# Altium schematic sheet 01_10_POWER_INPUT.SchDoc
size 289 x 396 mm
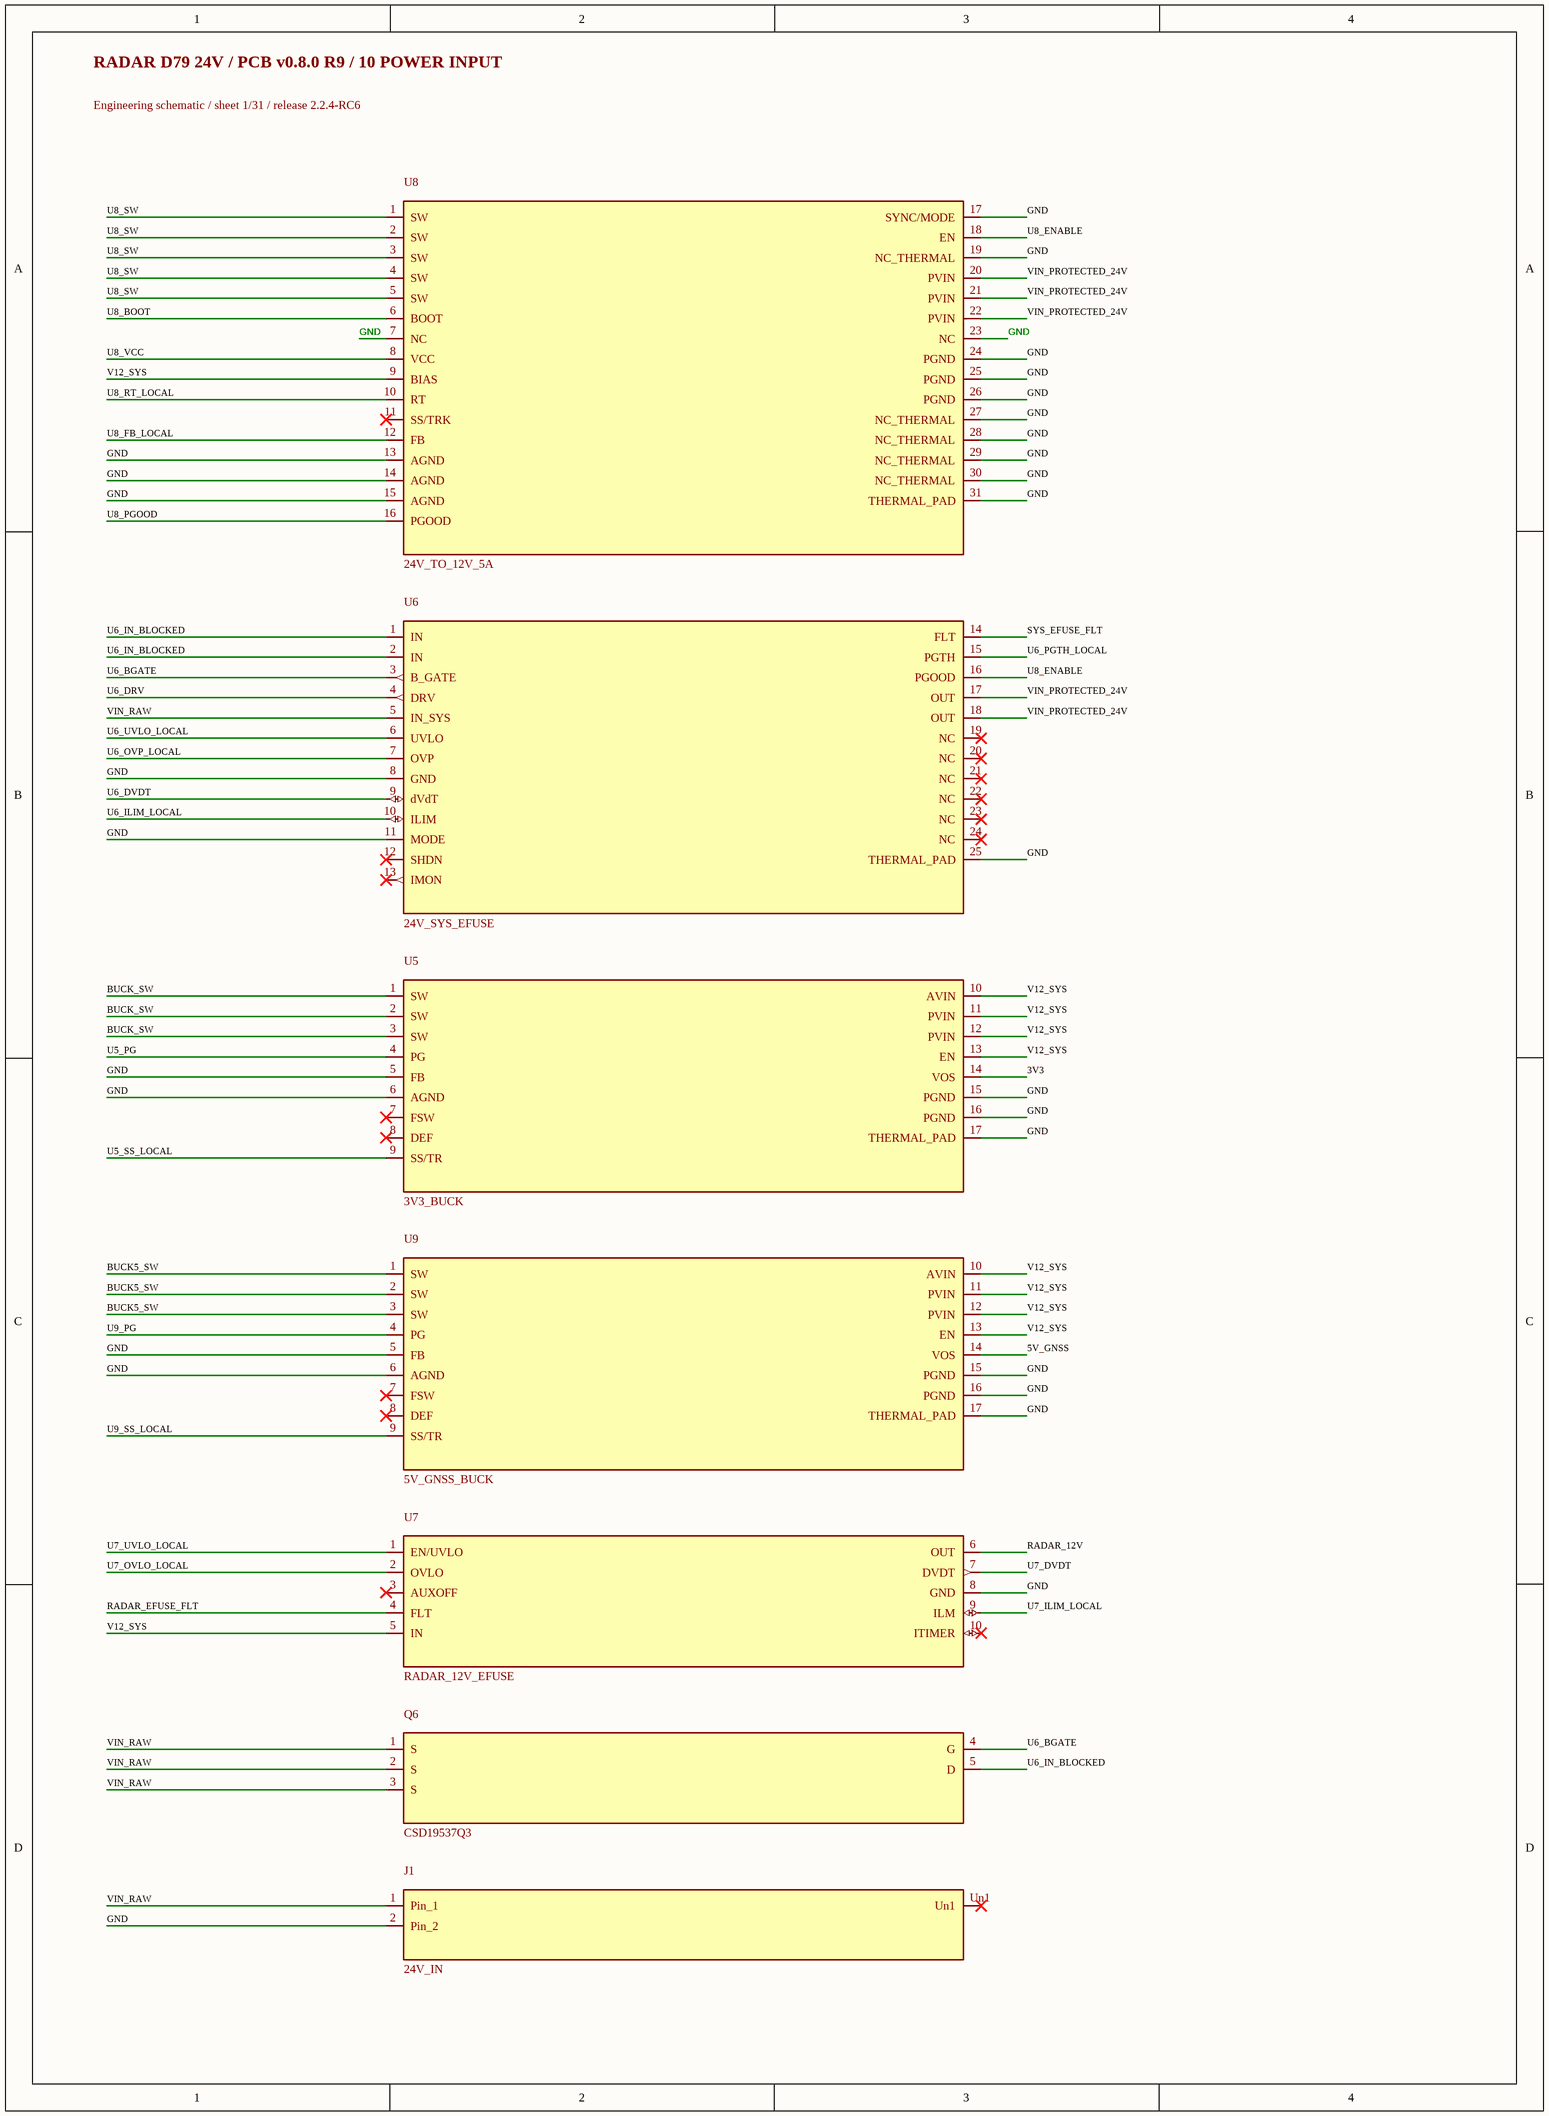
[diagram p0: 01_10_POWER_INPUT.SchDoc]

## Parts
J1  24V_IN  [Molex_43650-0200_RA_THT_2P]
Q6  CSD19537Q3  [VSON-8_3.3x3.3mm_P0.65mm_NexFET]
U5  3V3_BUCK  [VQFN-16-1EP_3x3mm_P0.5mm_EP1.68x1.68mm]
U6  24V_SYS_EFUSE  [Texas_RGE0024C_VQFN-24-1EP_4x4mm_P0.5mm_EP2.1x2.1mm]
U7  RADAR_12V_EFUSE  [TPS259470A_RPW0010A_VQFN-HR-10_2x2mm_P0.475mm]
U8  24V_TO_12V_5A  [Texas_RNP0030B_WQFN-30-1EP_4x6mm_P0.5mm_EP1.8x4.5mm_ThermalVias]
U9  5V_GNSS_BUCK  [VQFN-16-1EP_3x3mm_P0.5mm_EP1.68x1.68mm]

## Nets
3V3: U5.14(VOS)
5V_GNSS: U9.14(VOS)
BUCK5_SW: U9.1(SW) U9.2(SW) U9.3(SW)
BUCK_SW: U5.1(SW) U5.2(SW) U5.3(SW)
GND: J1.2(Pin_2) U5.5(FB) U5.6(AGND) U5.15(PGND) U5.16(PGND) U5.17(THERMAL_PAD) U6.8(GND) U6.11(MODE) U6.25(THERMAL_PAD) U7.8(GND) U8.7(NC) U8.13(AGND) U8.14(AGND) U8.15(AGND) U8.17(SYNC/MODE) U8.19(NC_THERMAL) U8.23(NC) U8.24(PGND) U8.25(PGND) U8.26(PGND) U8.27(NC_THERMAL) U8.28(NC_THERMAL) U8.29(NC_THERMAL) U8.30(NC_THERMAL) U8.31(THERMAL_PAD) U9.5(FB) U9.6(AGND) U9.15(PGND) U9.16(PGND) U9.17(THERMAL_PAD)
RADAR_12V: U7.6(OUT)
RADAR_EFUSE_FLT: U7.4(FLT)
SYS_EFUSE_FLT: U6.14(FLT)
U5_PG: U5.4(PG)
U5_SS_LOCAL: U5.9(SS/TR)
U6_BGATE: Q6.4(G) U6.3(B_GATE)
U6_DRV: U6.4(DRV)
U6_DVDT: U6.9(dVdT)
U6_ILIM_LOCAL: U6.10(ILIM)
U6_IN_BLOCKED: Q6.5(D) U6.1(IN) U6.2(IN)
U6_OVP_LOCAL: U6.7(OVP)
U6_PGTH_LOCAL: U6.15(PGTH)
U6_UVLO_LOCAL: U6.6(UVLO)
U7_DVDT: U7.7(DVDT)
U7_ILIM_LOCAL: U7.9(ILM)
U7_OVLO_LOCAL: U7.2(OVLO)
U7_UVLO_LOCAL: U7.1(EN/UVLO)
U8_BOOT: U8.6(BOOT)
U8_ENABLE: U6.16(PGOOD) U8.18(EN)
U8_FB_LOCAL: U8.12(FB)
U8_PGOOD: U8.16(PGOOD)
U8_RT_LOCAL: U8.10(RT)
U8_SW: U8.1(SW) U8.2(SW) U8.3(SW) U8.4(SW) U8.5(SW)
U8_VCC: U8.8(VCC)
U9_PG: U9.4(PG)
U9_SS_LOCAL: U9.9(SS/TR)
V12_SYS: U5.10(AVIN) U5.11(PVIN) U5.12(PVIN) U5.13(EN) U7.5(IN) U8.9(BIAS) U9.10(AVIN) U9.11(PVIN) U9.12(PVIN) U9.13(EN)
VIN_PROTECTED_24V: U6.17(OUT) U6.18(OUT) U8.20(PVIN) U8.21(PVIN) U8.22(PVIN)
VIN_RAW: J1.1(Pin_1) Q6.1(S) Q6.2(S) Q6.3(S) U6.5(IN_SYS)

Not connected (* = marked no-connect by the designer): J1 Un1*; U5 7(FSW)* 8(DEF)*; U6 12(SHDN)* 13(IMON)* 19(NC)* 20(NC)* 21(NC)* 22(NC)* 23(NC)* 24(NC)*; U7 3(AUXOFF)* 10(ITIMER)*; U8 11(SS/TRK)*; U9 7(FSW)* 8(DEF)*

## Notes on the sheet
- RADAR D79 24V / PCB v0.8.0 R9 / 10 POWER INPUT
- Engineering schematic / sheet 1/31 / release 2.2.4-RC6